# EAGLE design rotor_khamex_3.9_completo (EAGLE 7.6.0)

## Sheet 1 of 2
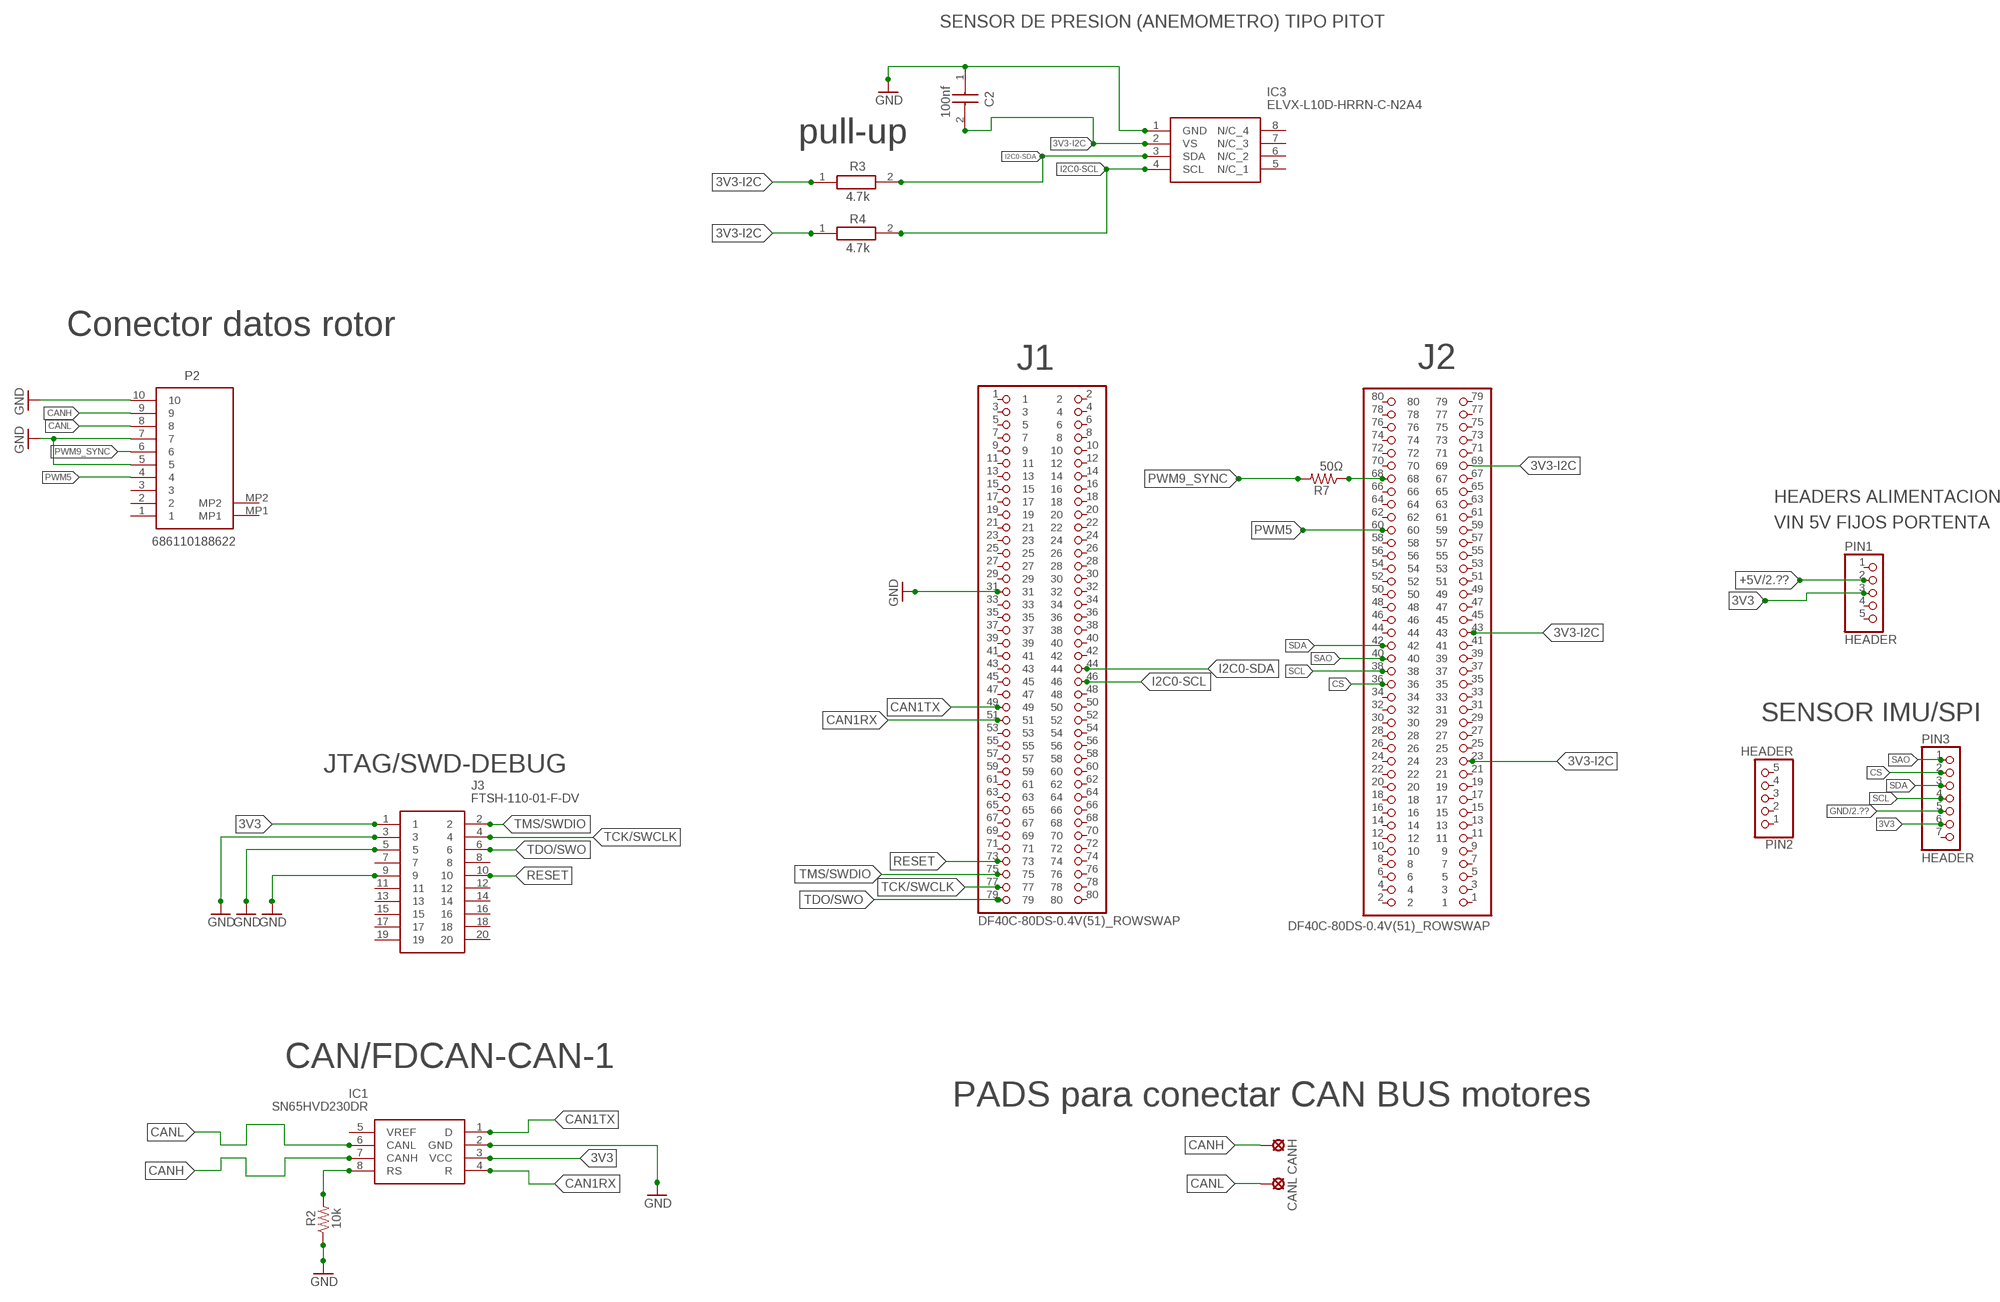
[diagram p0: schematic, sheet 1]

### Parts
C2  100nf  VJ0805Y104KCAAJ  [CAPC2012X145N]
CANH  LSP11  [LSP11]
CANL  LSP11  [LSP11]
IC1  SN65HVD230DR  [SOT127P600X175-8N]
IC3  ELVX-L10D-HRRN-C-N2A4  [ELVXL10DHRRNCN2A4]
J1  DF40C-80DS-0.4V(51)_ROWSWAP  [HRS_DF40C-80DS-0.4V(51)_ROWSWAP]
J2  DF40C-80DS-0.4V(51)_ROWSWAP  [HRS_DF40C-80DS-0.4V(51)_ROWSWAP]
J3  FTSH-110-01-F-DV  [FTSH-110-XX-YYY-DV]
P2  686110188622  [686110188622]
PIN1  HEADER  PINHD-1X5  [1X05]
PIN2  HEADER  PINHD-1X5  [1X05]
PIN3  HEADER  PINHD-1X7  [1X07]
R2  10k  R-US_M0805  [M0805]
R3  4.7k  CRCW08054K70FKEA  [RESC2012X50N]
R4  4.7k  CRCW08054K70FKEA  [RESC2012X50N]
R7  50Ω  R-US_M0805  [M0805]

### Nets
3V3: IC1.3(VCC) J3.1 PIN1.3 PIN3.6
3V3-I2C: C2.2 IC3.2(VS) J2.23 J2.43 J2.69 R3.1 R4.1
+5V [power]: PIN1.2 ; also sheet 2
CAN1RX: IC1.4(R) J1.51
CAN1TX: IC1.1(D) J1.49
CANH: CANH.MP IC1.7(CANH) P2.9
CANL: CANL.MP IC1.6(CANL) P2.8
CS: J2.36 PIN3.2
GND [power]: C2.1 IC1.2(GND) IC3.1(GND) J1.31 J3.3 J3.5 J3.9 P2.5 P2.7 P2.10 PIN3.5 R2.1 ; also sheet 2
I2C0-SCL: IC3.4(SCL) J1.46 R4.2
I2C0-SDA: IC3.3(SDA) J1.44 R3.2
N$15: IC1.8(RS) R2.2
PWM5: J2.60 P2.4
PWM9_SYNC: J2.68 P2.6 R7.1 R7.2
RESET: J1.73 J3.10
SAO: J2.40 PIN3.1
SCL: J2.38 PIN3.4
SDA: J2.42 PIN3.3
TCK/SWCLK: J1.77 J3.4
TDO/SWO: J1.79 J3.6
TMS/SWDIO: J1.75 J3.2
Unconnected: IC1.5(VREF) IC3.5(N/C_1) IC3.6(N/C_2) IC3.7(N/C_3) IC3.8(N/C_4) J1.1 J1.2 J1.3 J1.4 J1.5 J1.6 J1.7 J1.8 J1.9 J1.10 J1.11 J1.12 J1.13 J1.14 J1.15 J1.16 J1.17 J1.18 J1.19 J1.20 J1.21 J1.22 J1.23 J1.24 J1.25 J1.26 J1.27 J1.28 J1.29 J1.30 J1.32 J1.33 J1.34 J1.35 J1.36 J1.37 J1.38 J1.39 J1.40 J1.41 J1.42 J1.43 J1.45 J1.47 J1.48 J1.50 J1.52 J1.53 J1.54 J1.55 J1.56 J1.57 J1.58 J1.59 J1.60 J1.61 J1.62 J1.63 J1.64 J1.65 J1.66 J1.67 J1.68 J1.69 J1.70 J1.71 J1.72 J1.74 J1.76 J1.78 J1.80 J2.1 J2.2 J2.3 J2.4 J2.5 J2.6 J2.7 J2.8 J2.9 J2.10 J2.11 J2.12 J2.13 J2.14 J2.15 J2.16 J2.17 J2.18 J2.19 J2.20 J2.21 J2.22 J2.24 J2.25 J2.26 J2.27 J2.28 J2.29 J2.30 J2.31 J2.32 J2.33 J2.34 J2.35 J2.37 J2.39 J2.41 J2.44 J2.45 J2.46 J2.47 J2.48 J2.49 J2.50 J2.51 J2.52 J2.53 J2.54 J2.55 J2.56 J2.57 J2.58 J2.59 J2.61 J2.62 J2.63 J2.64 J2.65 J2.66 J2.67 J2.70 J2.71 J2.72 J2.73 J2.74 J2.75 J2.76 J2.77 J2.78 J2.79 J2.80 J3.7 J3.8 J3.11 J3.12 J3.13 J3.14 J3.15 J3.16 J3.17 J3.18 J3.19 J3.20 P2.1 P2.2 P2.3 P2.MP1 P2.MP2 PIN1.1 PIN1.4 PIN1.5 PIN2.1 PIN2.2 PIN2.3 PIN2.4 PIN2.5 PIN3.7

### Notes on the sheet
- SENSOR DE PRESION (ANEMOMETRO) TIPO PITOT
- pull-up
- 4.7k
- 4.7k
- Conector datos rotor
- HEADERS ALIMENTACION
- VIN 5V FIJOS PORTENTA
- SENSOR IMU/SPI
- JTAG/SWD-DEBUG
- CAN/FDCAN-CAN-1
- PADS para conectar CAN BUS motores

## Sheet 2 of 2
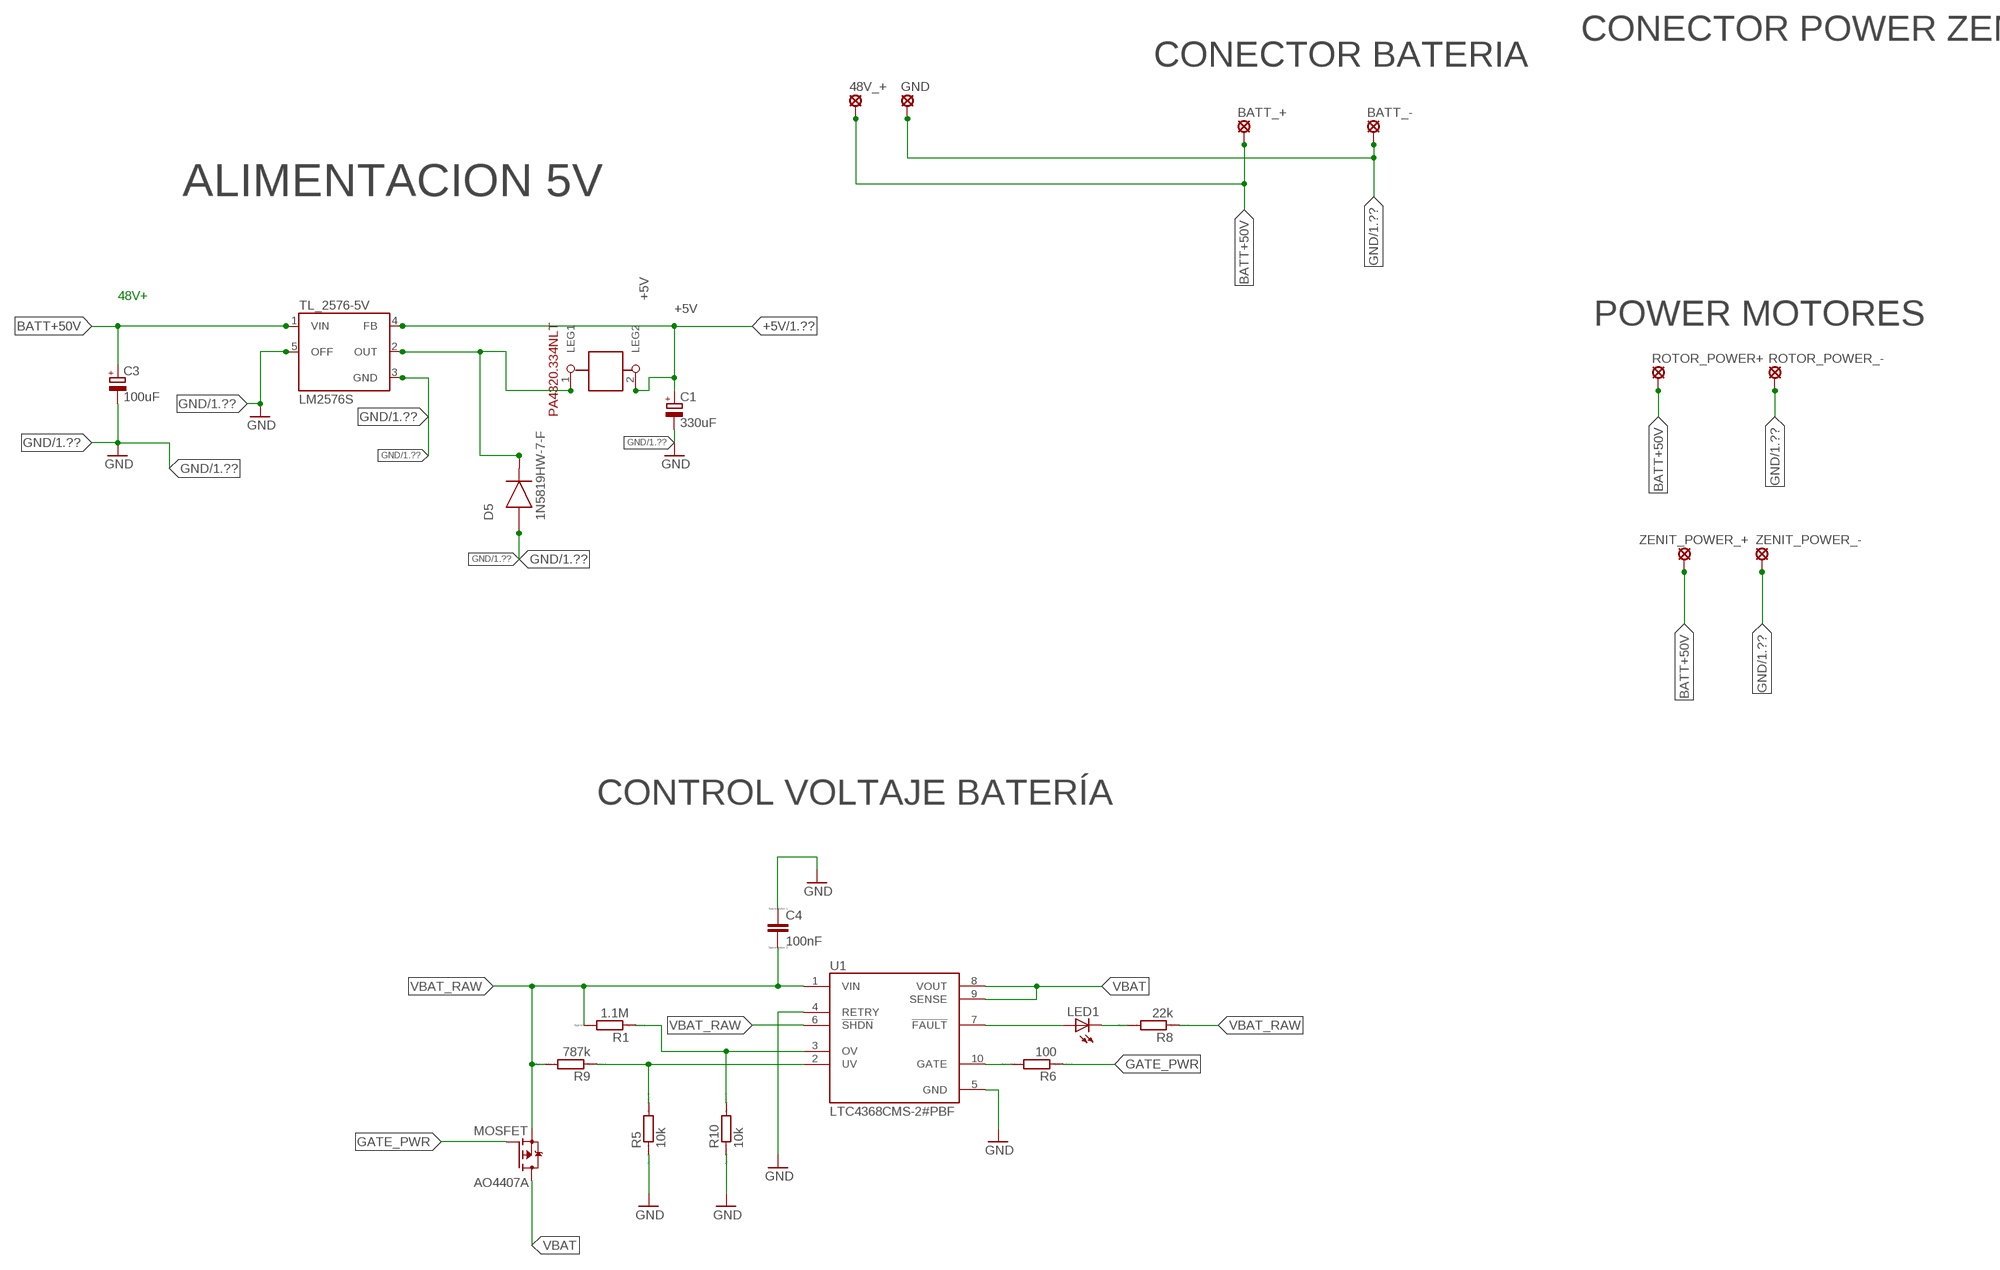
[diagram p1: schematic, sheet 2]

### Parts
48V_+  SE14  [SE14]
BATT_+  SE14  [SE14]
BATT_-  SE14  [SE14]
C1  330uF  CPOL-EUE5-10.5  [E5-10,5]
C3  100uF  CPOL-EUE5-10.5  [E5-10,5]
C4  100nF  C  [C0805]
D5  1N5819HW-7-F  [SOD370155X135]
GND  SE14  [SE14]
L  1212  [1212SMDINDUCTORPACK]
LED1  LED  [SMARTLED-TTW]
MOSFET  AO4407A  [SOIC127P600X175-8N]
R1  1.1M  R  [R0805]
R5  10k  R  [R0805]
R6  100  R  [R0805]
R8  22k  R  [R0805]
R9  787k  R  [R0805]
R10  10k  R  [R0805]
ROTOR_POWER+  SE14  [SE14]
ROTOR_POWER_-  SE14  [SE14]
TL_2576-5V  LM2576S  [TO263-5]
U1  LTC4368CMS-2#PBF  [SOP50P490X110-10N]
ZENIT_POWER_+  SE14  [SE14]
ZENIT_POWER_-  SE14  [SE14]

### Nets
+5V [power]: C1.+ L.2(LEG2) TL_2576-5V.4(FB) ; also sheet 1
BATT+50V [power]: 48V_+.MP BATT_+.MP C3.+ D5.1(C) L.1(LEG1) ROTOR_POWER+.MP TL_2576-5V.1(VIN) TL_2576-5V.2(OUT) ZENIT_POWER_+.MP
GATE_PWR: MOSFET.4(G) R6.1
GND [power]: BATT_-.MP C1.- C3.- C4.1 D5.2(A) GND.MP R5.1 R10.1 ROTOR_POWER_-.MP TL_2576-5V.3(GND) TL_2576-5V.5(OFF) U1.4(RETRY) U1.5(GND) ZENIT_POWER_-.MP ; also sheet 1
N$2: LED1.A@1(A) U1.7(!FAULT)
N$11: R5.2 R9.1 U1.2(UV)
N$12: R1.1 R10.2 U1.3(OV)
N$13: LED1.C@1(C) R8.2
N$14: R6.2 U1.10(GATE)
VBAT: MOSFET.5(D) MOSFET.6(D) MOSFET.7(D) MOSFET.8(D) U1.8(VOUT) U1.9(SENSE)
VBAT_RAW: C4.2 MOSFET.1(S) MOSFET.2(S) MOSFET.3(S) R1.2 R8.1 R9.2 U1.1(VIN) U1.6(!SHDN)

### Notes on the sheet
- CONECTOR POWER ZENIT
- CONECTOR BATERIA
- ALIMENTACION 5V
- 48V+
- POWER MOTORES
- CONTROL VOLTAJE BATERÍA

## Library data of the parts
48V_+ BATT_+ BATT_- GND ROTOR_POWER+ ROTOR_POWER_- ZENIT_POWER_+ ZENIT_POWER_- = solpad:SE14: SOLDER PAD E1553, drill 1,4mm, distributor Buerklin, 07F820
C1 C3 = rcl:CPOL-EU: POLARIZED CAPACITOR, European symbol
C2 = VJ0805Y104KCAAJ:VJ0805Y104KCAAJ: Vishay VJ0805 series Capacitor Chips Source: Datasheet <http://www.vishay.com/docs/45226/vj31xrohsautomlcc.pdf>; DESCRIPTION: Vishay VJ0805 series Capacitor Chips; HEIGHT: 1.45mm; MANUFACTURER_NAME: Vishay; MANUFACTURER_PART_NUMBER: VJ0805Y104KCAAJ
C4 = eagle-ltspice:C: CAPACITOR, European symbol; SPICEMODEL: NONE; SPICEPREFIX: C
CANH CANL = solpad:LSP11: SOLDER PAD drill 1.1 mm
D5 = 1N5819HW-7-F:1N5819HW-7-F: 1N5819HW Series 40 V 1 A Surface Mount Schottky Barrier Rectifier - SOD-123; DESCRIPTION: 1N5819HW Series 40 V 1 A Surface Mount Schottky Barrier Rectifier - SOD-123; DIGI-KEY_PART_NUMBER: 1N5819HW-FDICT-ND; DIGI-KEY_PURCHASE_URL: https://www.digikey.es/product-detail/en/diodes-incorporated/1N5819HW-7-F/1N5819HW-FDICT-ND/815283?utm_source=snapeda&utm_medium=aggregator&utm_campaign=symbol; MF: Diodes Inc.; MP: 1N5819HW-7-F; PACKAGE: SOD-123 Diodes Inc.
IC1 = SN65HVD230DR:SN65HVD230DR: 3.3 V CAN Transceiver with Standby Mode Source: Datasheet <http://www.ti.com/lit/gpn/sn65hvd230>; DESCRIPTION: 3.3 V CAN Transceiver with Standby Mode; HEIGHT: 1.75mm; MANUFACTURER_NAME: Texas Instruments; MANUFACTURER_PART_NUMBER: SN65HVD230DR; MOUSER_PART_NUMBER: 595-SN65HVD230DR; MOUSER_PRICE-STOCK: https://www.mouser.co.uk/ProductDetail/Texas-Instruments/SN65HVD230DR?qs=QViXGNcIEAtifeQR3pYVUQ%3D%3D
IC3 = ELVX-L10D-HRRN-C-N2A4:ELVX-L10D-HRRN-C-N2A4: Pressure Sensor +/-0.36PSI (+/-2.49kPa) Differential Male - 0.08" (1.93mm) Tube, Dual 14 b 8-SMD, No Lead, Dual Ports, Same Side, 3.3V, -25C ~ 85C Source: Datasheet <https://allsensors.com/hubfs/Product-Data-Sheets/DS-0452.pdf>; DESCRIPTION: Pressure Sensor +/-0.36PSI (+/-2.49kPa) Differential Male - 0.08" (1.93mm) Tube, Dual 14 b 8-SMD, No Lead, Dual Ports, Same Side, 3.3V, -25C ~ 85C; HEIGHT: 4.33mm; MANUFACTURER_NAME: Amphenol; MANUFACTURER_PART_NUMBER: ELVX-L10D-HRRN-C-N2A4
J1 J2 = DF40C-80DS-0.4V_51_ROWSWAP:DF40C-80DS-0.4V(51)_ROWSWAP; CHECK_PRICES: https://www.snapeda.com/parts/DF40C-80DS-0.4V(51)/Hirose/view-part/?ref=eda; DESCRIPTION: Receptáculo del conector de la posición 80, contactos de la tira central Montaje en superficie Oro; DIGIKEY_PART_NUMBER: H11633CT-ND; MF: Hirose; MP: DF40C-80DS-0.4V(51); PACKAGE: None; SNAPEDA_LINK: https://www.snapeda.com/parts/DF40C-80DS-0.4V(51)/Hirose/view-part/?ref=snap
J3 = FTSH-110-01-F-DV:FTSH-110-01-F-DV: 20 Position, High Reliability Header Strips, 0.050" pitch Source: Datasheet <http://suddendocs.samtec.com/prints/ftsh-1xx-xx-xxx-dv-xxx-xxx-mkt.pdf>; DESCRIPTION: 20 Position, High Reliability Header Strips, 0.050&quot; pitch; HEIGHT: mm; MANUFACTURER_NAME: SAMTEC; MANUFACTURER_PART_NUMBER: FTSH-110-01-F-DV; MOUSER_PART_NUMBER: 200-FTSH11001FDV; MOUSER_PRICE-STOCK: https://www.mouser.co.uk/ProductDetail/Samtec/FTSH-110-01-F-DV?qs=92ilVni64gw1JaTDl9rCLg%3D%3D
L = smd 1212 inductor:1212
LED1 = led:LED: LED OSRAM: - CHIPLED LG R971, LG N971, LY N971, LG Q971, LY Q971, LO R971, LY R971 LH N974, LH R974 LS Q976, LO Q976, LY Q976 LO Q996 - Hyper CHIPLED LW Q18S LB Q993, LB Q99A, LB R99A - SideLED LS A670, LO A670, LY A670, LG A670, LP A670 LB A673, LV A673, LT A673, LW A673 LH A674 LY A675 LS A676, LA A676, LO A676, LY A676, LW A676 LS A679, LY A679, LG A679 - Hyper Micro SIDELED® LS Y876, LA Y876, LO Y876, LY Y876 LT Y87S - SmartLED LW L88C, LW L88S LB L89C, LB L89S, LG L890 LS L89K, LO L89K, LY L89K LS L896, LA L896, LO L896, LY L896 - TOPLED LS T670, LO T670, LY T670, LG T670, LP T670 LSG T670, LSP T670, LSY T670, LOP T670, LYG T670 LG T671, LOG T671, LSG T671 LB T673, LV T673, LT T673, LW T673 LH T674 LS T676, LA T676, LO T676, LY T676, LB T676, LH T676, LSB T676, LW T676 LB T67C, LV T67C, LT T67C, LS T67K, LO T67K, LY T67K, LW E67C LS E67B, LA E67B, LO E67B, LY E67B, LB E67C, LV E67C, LT E67C LW T67C LS T679, LY T679, LG T679 LS T770, LO T770, LY T770, LG T770, LP T770 LB T773, LV T773, LT T773, LW T773 LH T774 LS E675, LA E675, LY E675, LS T675 LS T776, LA T776, LO T776, LY T776, LB T776 LHGB T686 LT T68C, LB T68C - Hyper Mini TOPLED® LB M676 - Mini TOPLED Santana® LG M470 LS M47K, LO M47K, LY M47K Source: http://www.osram.convergy.de LUXEON: - LUMILED® LXK2-PW12-R00, LXK2-PW12-S00, LXK2-PW14-U00, LXK2-PW14-V00 LXK2-PM12-R00, LXK2-PM12-S00, LXK2-PM14-U00 LXK2-PE12-Q00, LXK2-PE12-R00, LXK2-PE12-S00, LXK2-PE14-T00, LXK2-PE14-U00 LXK2-PB12-K00, LXK2-PB12-L00, LXK2-PB12-M00, LXK2-PB14-N00, LXK2-PB14-P00, LXK2-PB14-Q00 LXK2-PR12-L00, LXK2-PR12-M00, LXK2-PR14-Q00, LXK2-PR14-R00 LXK2-PD12-Q00, LXK2-PD12-R00, LXK2-PD12-S00 LXK2-PH12-R00, LXK2-PH12-S00 LXK2-PL12-P00, LXK2-PL12-Q00, LXK2-PL12-R00 Source: www.luxeon.com KINGBRIGHT: KA-3528ASYC Source: www.kingbright.com
MOSFET = AO4407A:AO4407A: Check availability <https://pricing.snapeda.com/parts/AO4407A/Alpha%20%26/view-part?ref=eda>; AVAILABILITY: In Stock; CHECK_PRICES: https://www.snapeda.com/parts/AO4407A/Alpha/view-part/?ref=eda; DESCRIPTION: P-Channel 30 V 12A (Ta) 3.1W (Ta) Surface Mount 8-SOIC; MF: Alpha &; MP: AO4407A; PACKAGE: SOIC-8 Alpha &amp; Omega Semiconductor; PRICE: None; SNAPEDA_LINK: https://www.snapeda.com/parts/AO4407A/Alpha/view-part/?ref=snap
P2 = 686110188622:686110188622: FFC & FPC Connectors WR-FPC 1,0mm SMT Horiz. Top Contact Tin Plating{0000} Source: Datasheet <https://www.mouser.ch/datasheet/2/445/686110188622-1843591.pdf>; DESCRIPTION: FFC & FPC Connectors WR-FPC 1,0mm SMT Horiz. Top Contact Tin Plating{0000}; HEIGHT: 3.3mm; MANUFACTURER_NAME: Wurth Elektronik; MANUFACTURER_PART_NUMBER: 686110188622; MOUSER_PART_NUMBER: 710-686110188622; MOUSER_PRICE-STOCK: https://www.mouser.co.uk/ProductDetail/Wurth-Elektronik/686110188622?qs=OlC7AqGiEDnHUpT6yh27Lg%3D%3D
PIN1 PIN2 = pinhead:PINHD-1X5: PIN HEADER
PIN3 = pinhead:PINHD-1X7: PIN HEADER
R1 R5 R6 R8-R10 = eagle-ltspice:R: RESISTOR, European symbol; SPICEMODEL: NONE; SPICEPREFIX: R
R2 R7 = rcl:R-US_: RESISTOR, American symbol
R3 R4 = CRCW08054K70FKEA:CRCW08054K70FKEA: Vishay CRCW Series Thick Film Surface Mount Resistor 805 Case 4.7k +/-1% 0.125W +/-100ppm/C Source: Datasheet <http://www.vishay.com/docs/20035/dcrcwe3.pdf>; DESCRIPTION: Vishay CRCW Series Thick Film Surface Mount Resistor 805 Case 4.7k +/-1% 0.125W +/-100ppm/C; HEIGHT: 0.5mm; MANUFACTURER_NAME: Vishay; MANUFACTURER_PART_NUMBER: CRCW08054K70FKEA; MOUSER_PART_NUMBER: 71-CRCW0805-4.7K-E3; MOUSER_PRICE-STOCK: https://www.mouser.co.uk/ProductDetail/Vishay-Dale/CRCW08054K70FKEA?qs=kkyyugUlSrMIzNiWjd4LGQ%3D%3D
TL_2576-5V = v-reg-3:LM2576: National Semiconductor <http://www.national.com> 3.0A "Simple Switcher"(c) 52kHz, Vout 1.23-37V (HV: 57V), Vin 40V (HV: 60V), 50µA standby current
U1 = LTC4368CMS-2_PBF:LTC4368CMS-2#PBF: Check availability <https://pricing.snapeda.com/parts/LTC4368CMS-2%23PBF/Analog%20Devices/view-part?ref=eda>; AVAILABILITY: In Stock; CHECK_PRICES: https://www.snapeda.com/parts/LTC4368CMS-2%23PBF/Analog+Devices/view-part/?ref=eda; DESCRIPTION: 100V UV/OV and Reverse Protection Controller with Bidirectional Circuit Breaker; MF: Analog Devices; MP: LTC4368CMS-2#PBF; PACKAGE: MSOP-10 Analog Devices; PRICE: None; SNAPEDA_LINK: https://www.snapeda.com/parts/LTC4368CMS-2%23PBF/Analog+Devices/view-part/?ref=snap

## Net classes
0 default: width 0.152 mm, drill 0.305 mm, clearance 0.152 mm
1 power: width 0.127 mm, drill 0.305 mm, clearance 0.127 mm
2 thin: width 0.508 mm, drill 0.305 mm, clearance 0.152 mm

## Board
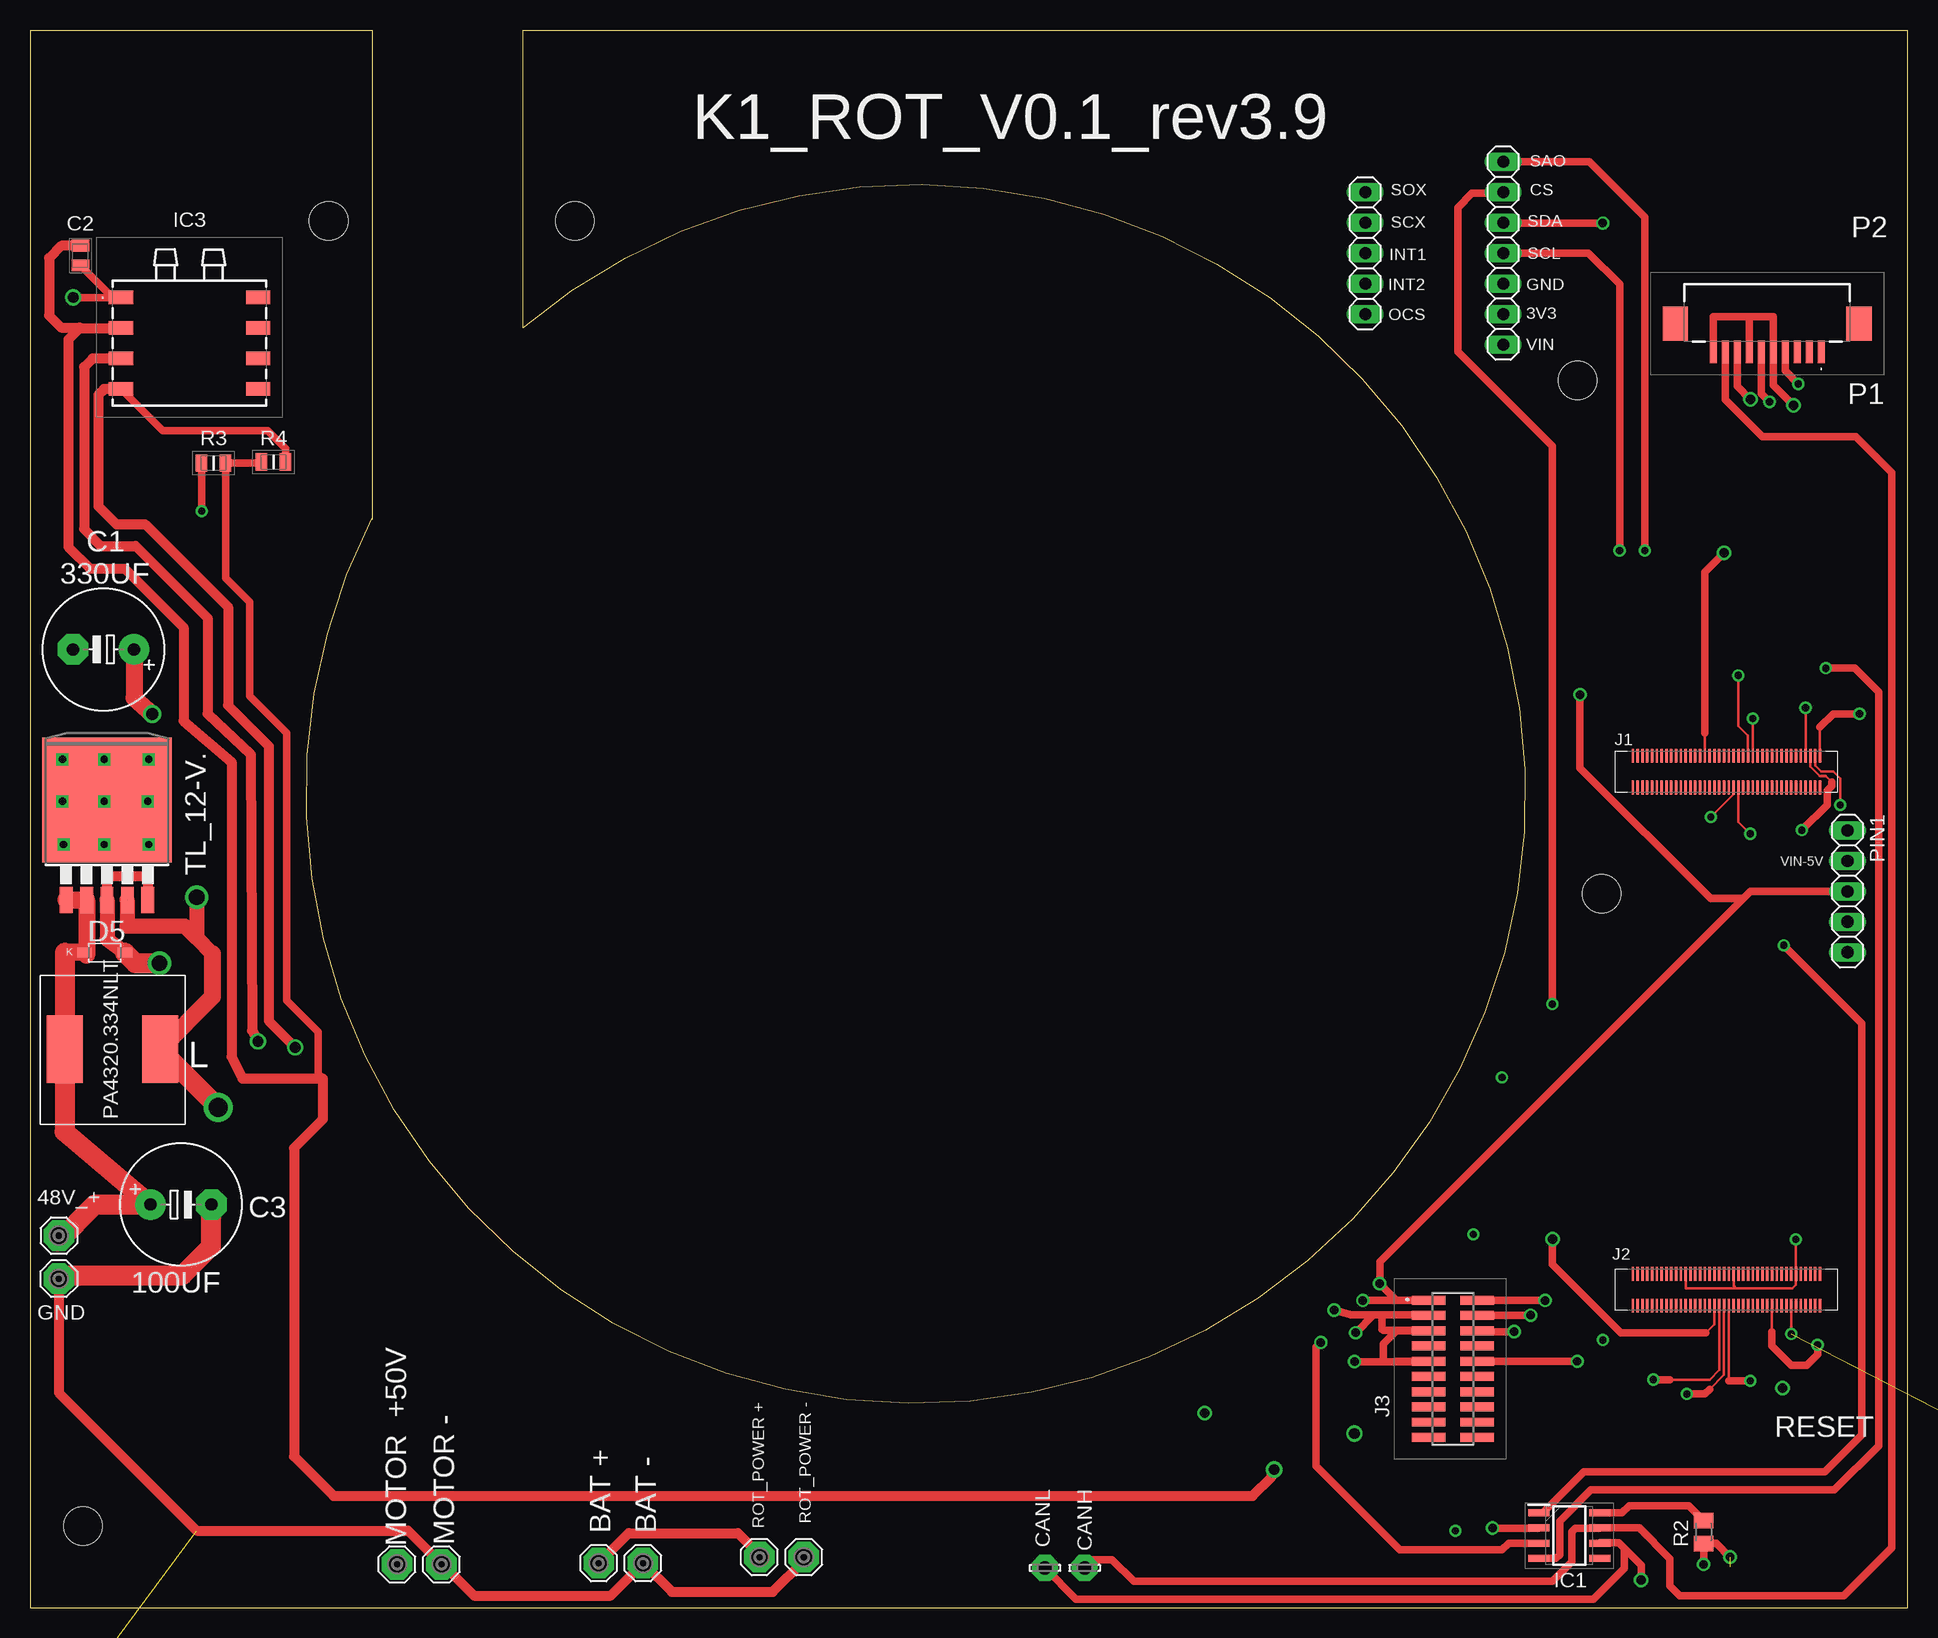
[diagram p2: board, top side]
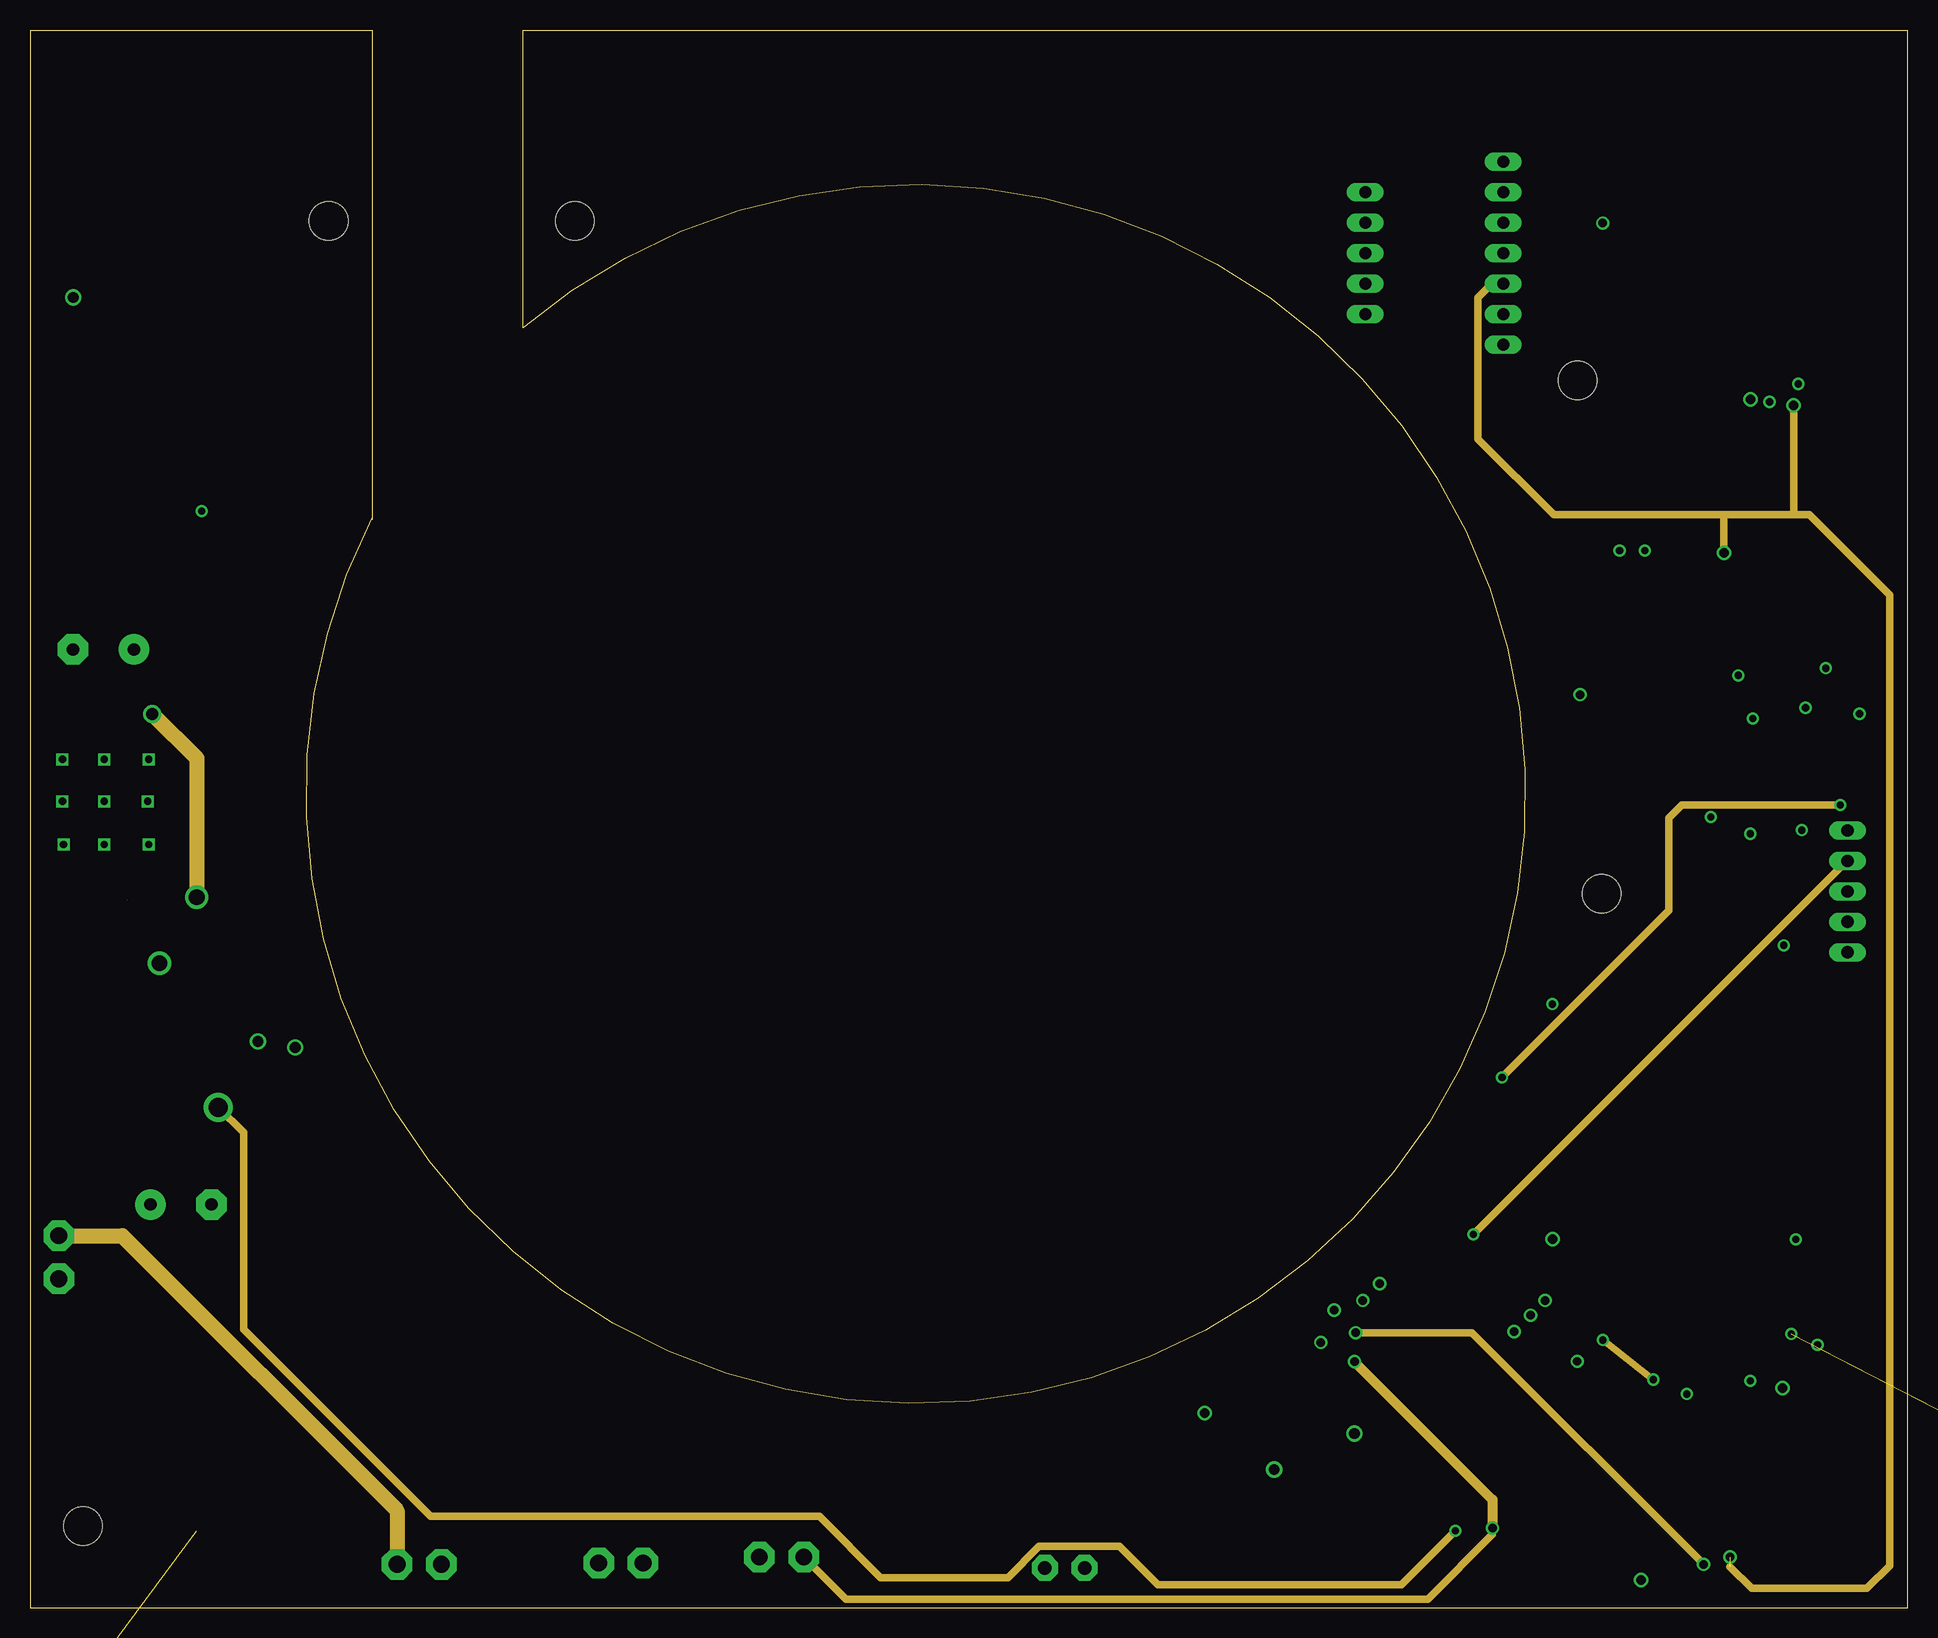
[diagram p3: board, inner layer Route2]
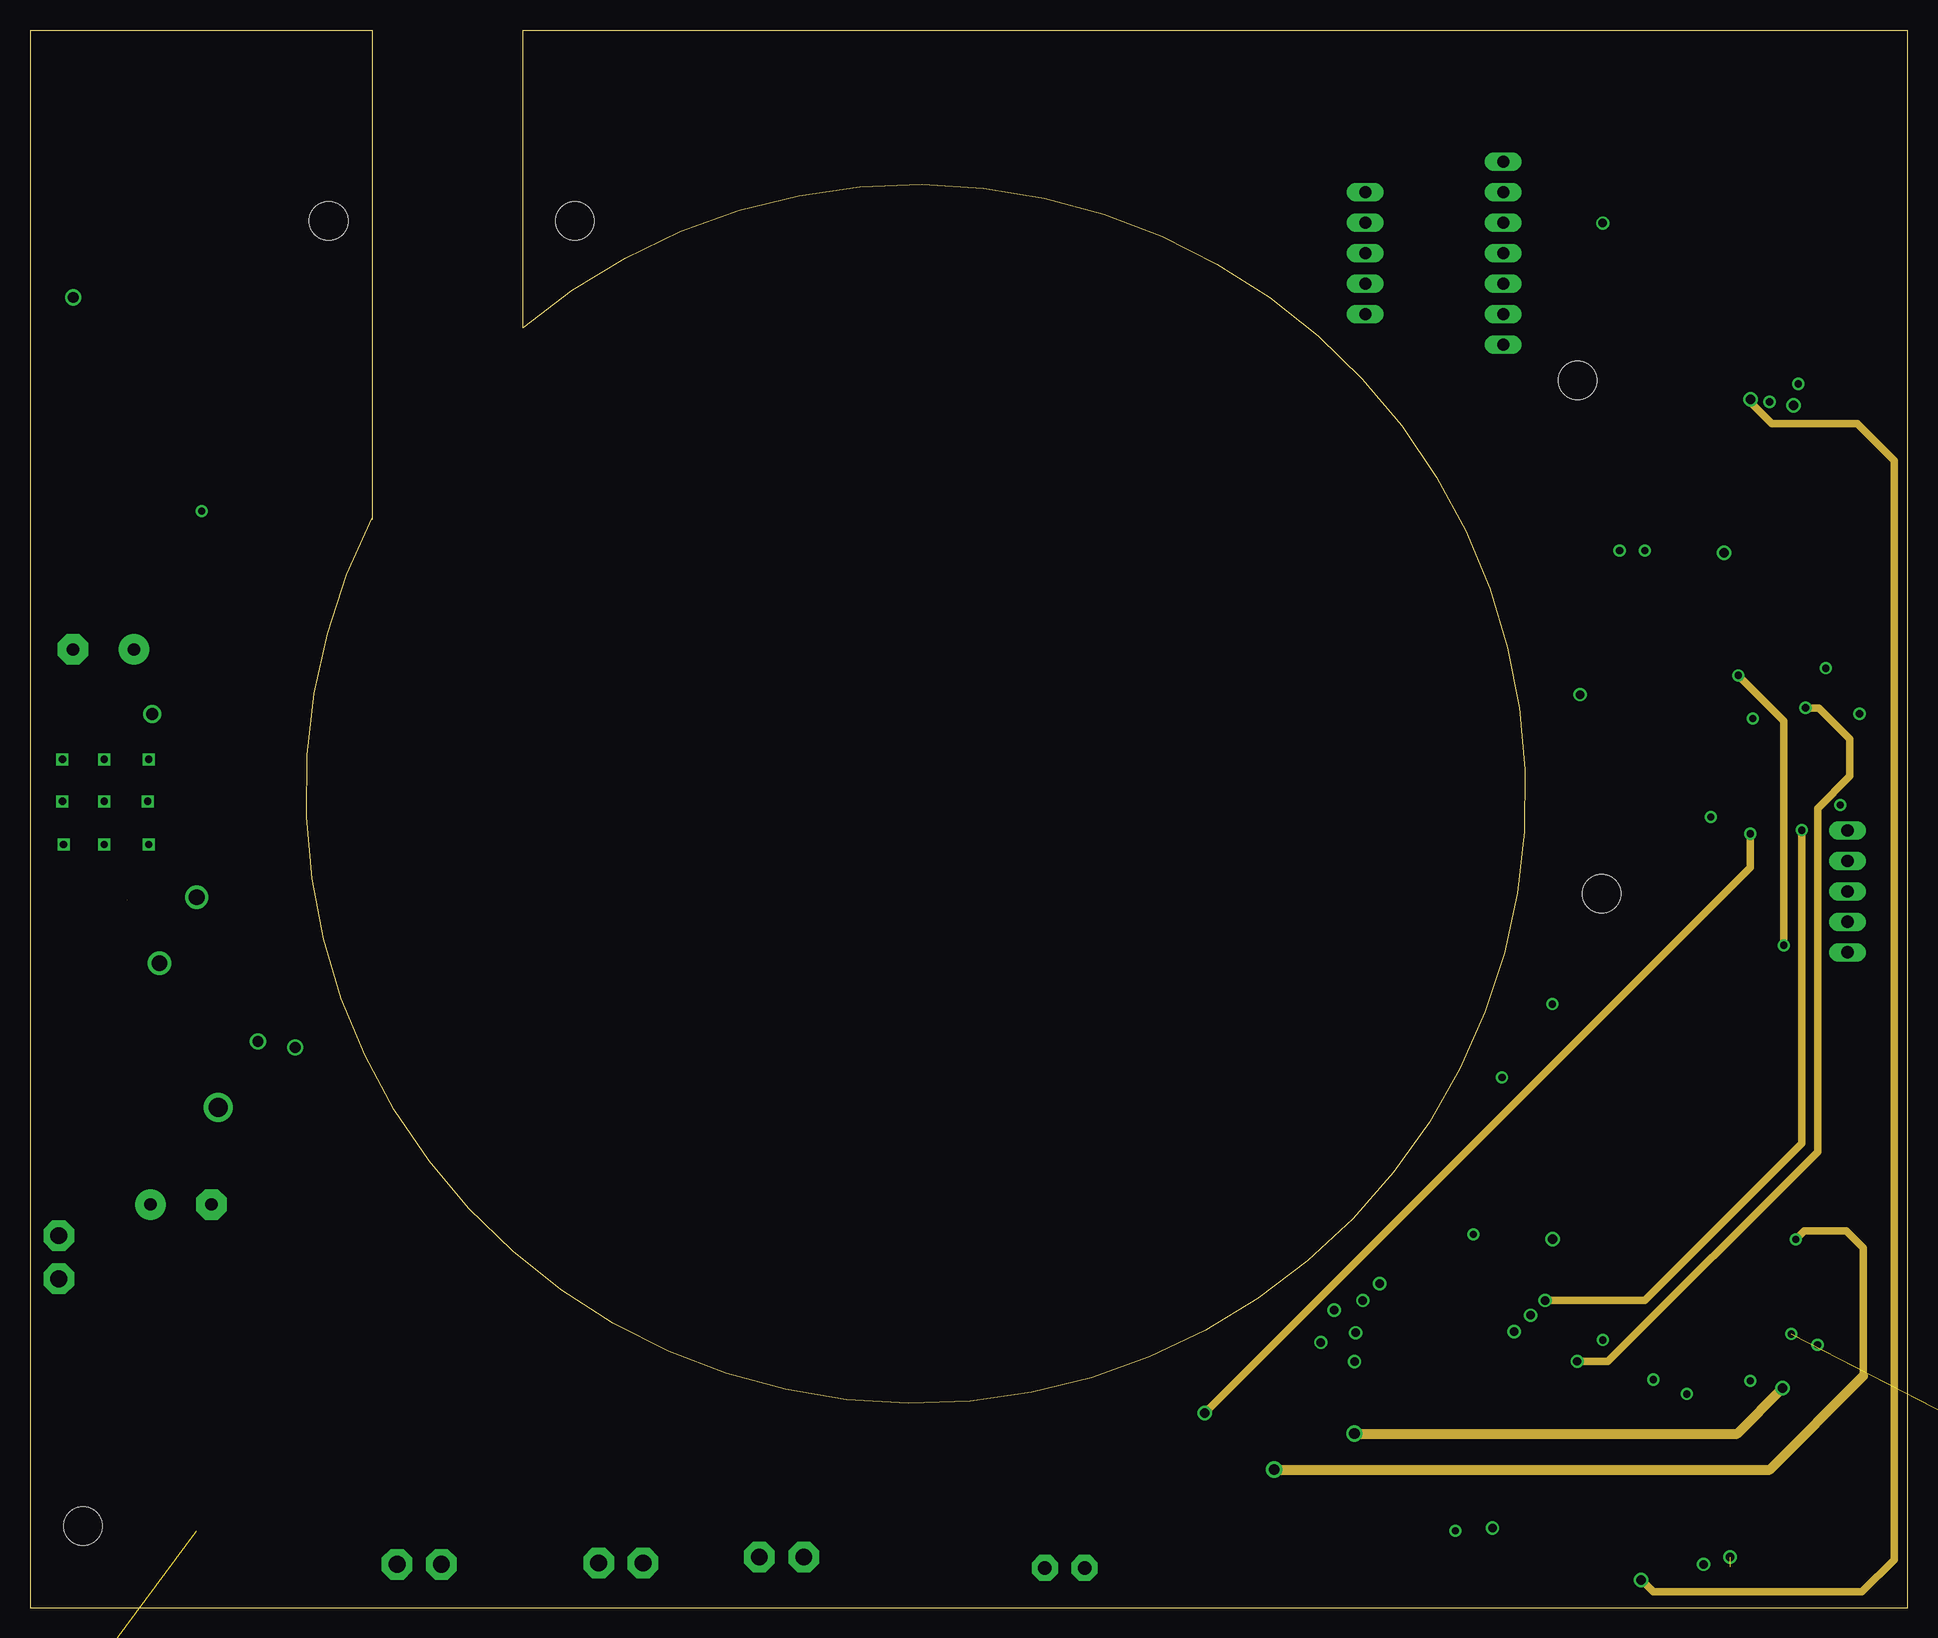
[diagram p4: board, inner layer Route15]
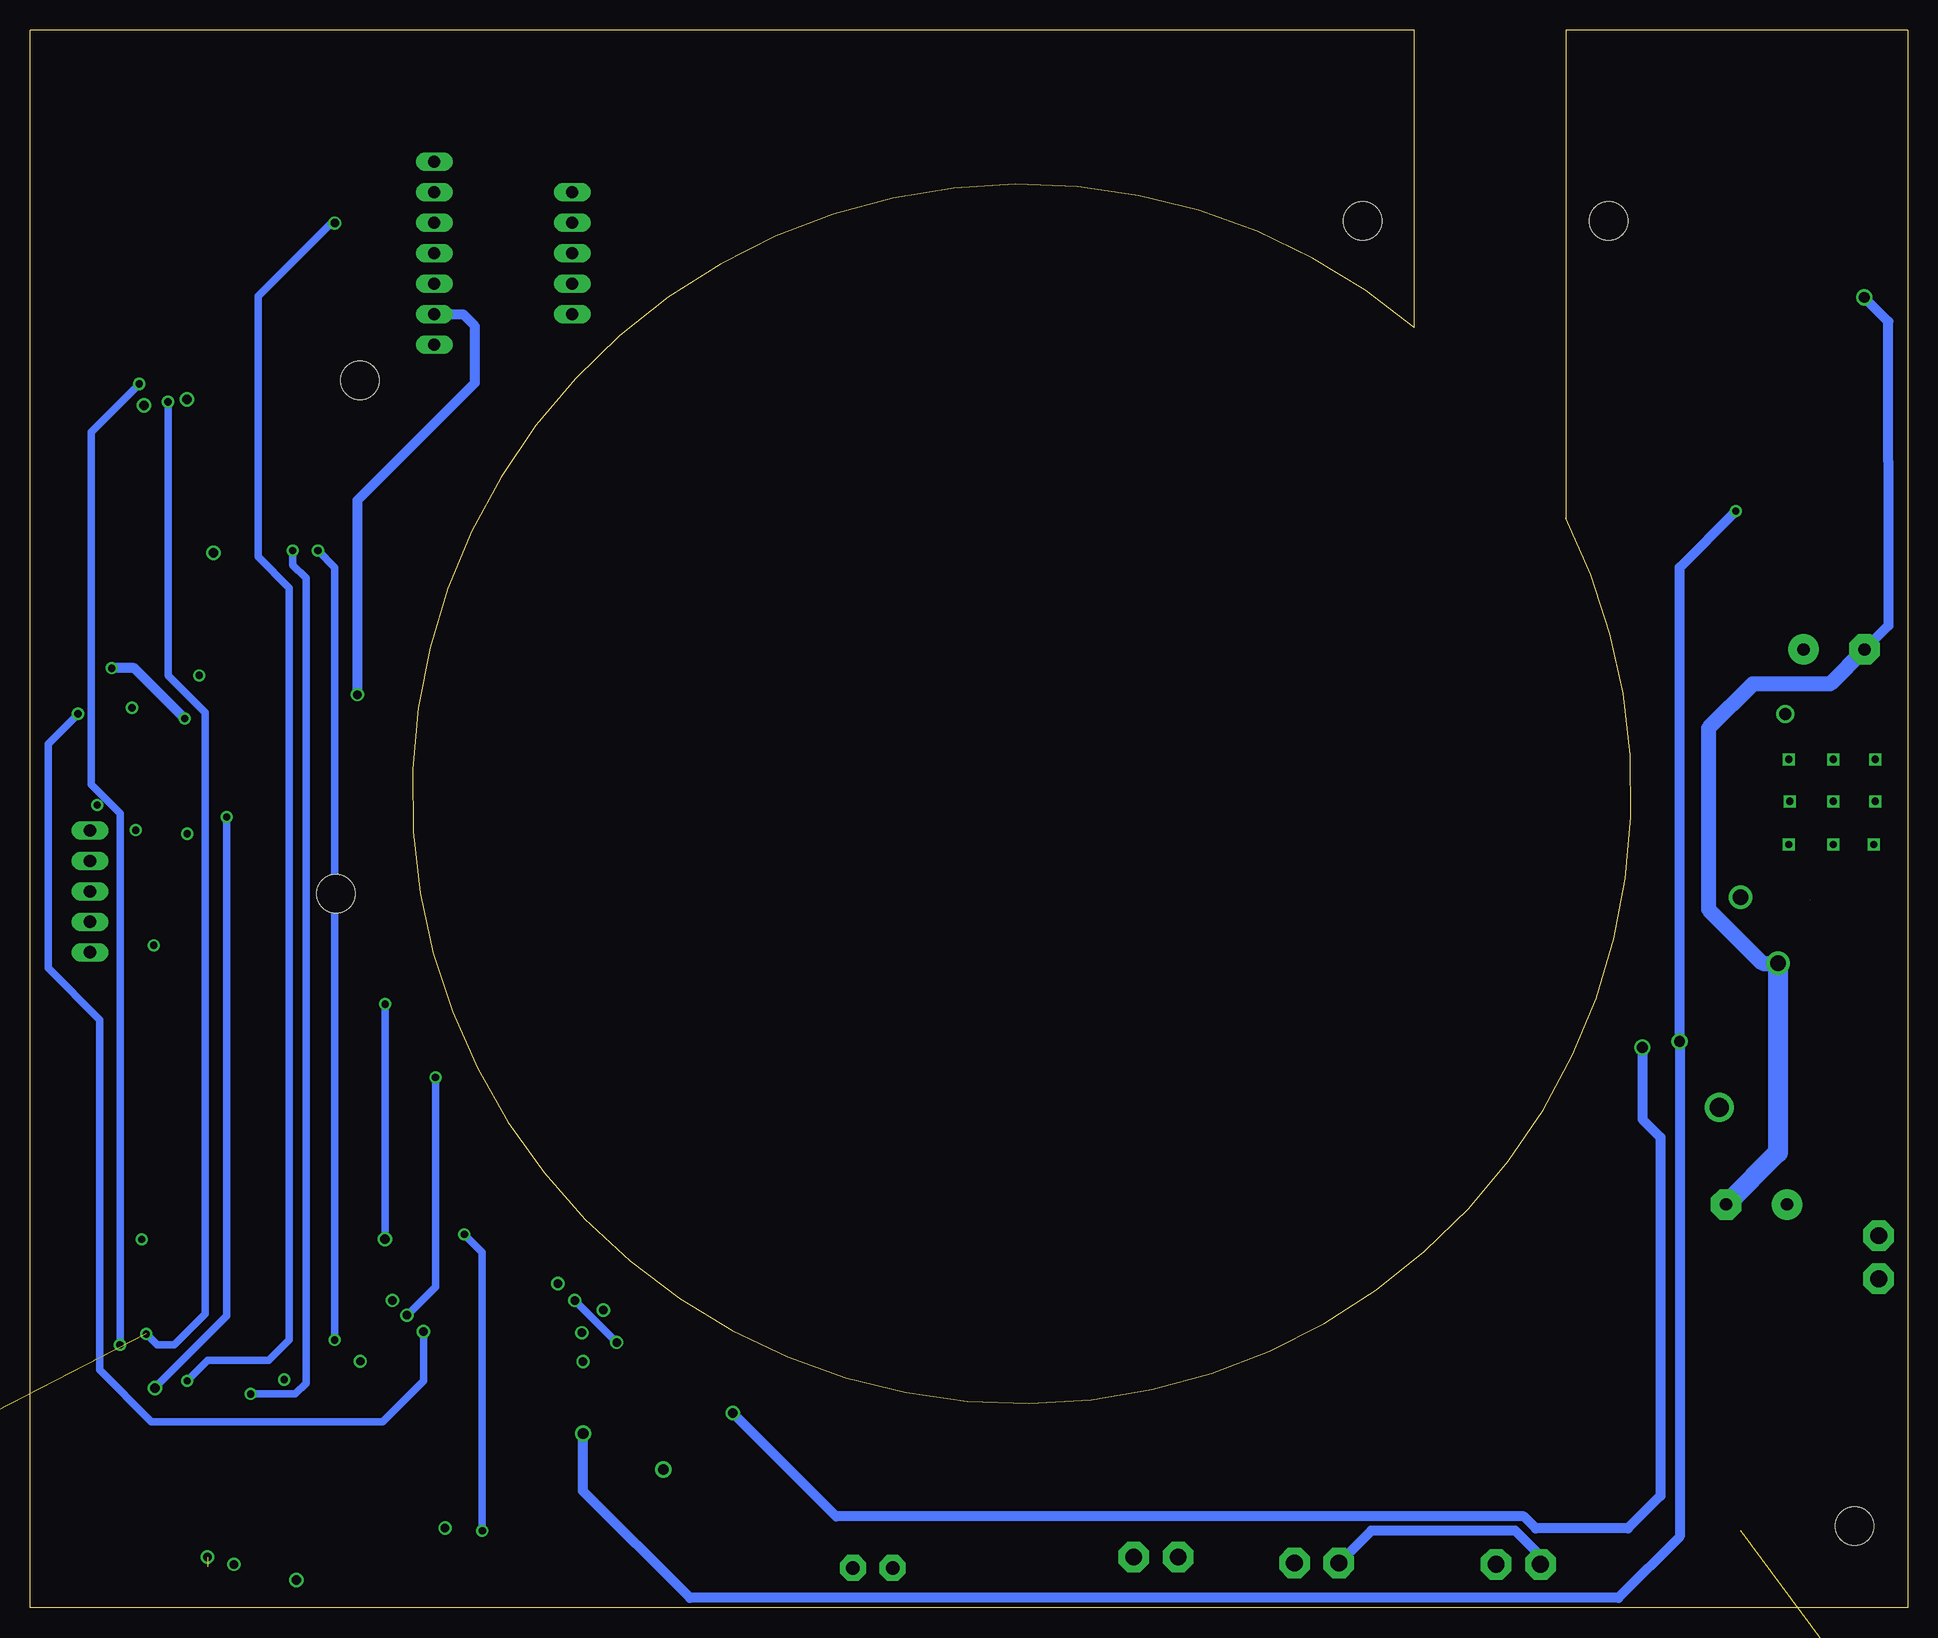
[diagram p5: board, bottom side, seen from below]

Size 156.5 x 131.5 mm. Coordinates in mm from the lower left corner, seen from the top.
Outline: 28.5,90.8 28.5,131.5 0,131.5 0,0 156.5,0 156.5,131.5 41.1,131.5 41.1,106.7 arc-337 28.5,90.8
Outline: 28.5,90.8 28.5,90.7
Copper layers (1*16): Top 0.035mm / dielectric 1.5mm / Bottom 0.035mm
Design rules "default": minimum track width 10mil, minimum drill 24mil, track to track 8mil, track to pad 8mil, pad to pad 8mil, via to via 8mil, smd to smd 8mil, copper to edge 40mil, drill to drill 8mil, minimum pad ring 10mil, minimum via ring 8mil, stop-mask expansion 4mil, vias tented up to drill 0mil, thermal gap 10mil
Holes 3.2 mm at 131,59.5 129,102.3 4.4,6.8 24.9,115.6 45.4,115.6

### Footprints (pad centres in the part's own frame; a part is rotated, then mirrored left to right if it is on the bottom)
SE14 = drill 1.397 pad 2.54 octagon: MP 0,0
E5-10,5 = drill 1.016 pad 2.54: + -2.54,0 | drill 1.016 pad 2.54 octagon: - 2.54,0
CAPC2012X145N = smd 0.99 x 1.47: 1 -0.82,0; 2 0.82,0
C0805 = smd 1.3 x 1.5: 1 -0.95,0; 2 0.95,0
LSP11 = drill 1.118 pad 2.159 octagon: MP 0,0
SOD370155X135 = smd 1.21 x 0.73: 1 -1.68,0; 2 1.68,0
SOT127P600X175-8N = smd 1.75 x 0.6: 1 -2.55,1.905; 2 -2.55,0.635; 3 -2.55,-0.635; 4 -2.55,-1.905; 5 2.55,-1.905; 6 2.55,-0.635; 7 2.55,0.635; 8 2.55,1.905
ELVXL10DHRRNCN2A4 = smd 2.03 x 1.14: 1 -5.715,2.5; 2 -5.715,-0.04; 3 -5.715,-2.58; 4 -5.715,-5.12; 5 5.715,-5.12; 6 5.715,-2.58; 7 5.715,-0.04; 8 5.715,2.5
HRS_DF40C-80DS-0.4V(51)_ROWSWAP = smd 0.2 x 1.14: 1 -7.8,1.32; 2 -7.8,-1.32; 3 -7.4,1.32; 4 -7.4,-1.32; 5 -7,1.32; 6 -7,-1.32; 7 -6.6,1.32; 8 -6.6,-1.32; 9 -6.2,1.32; 10 -6.2,-1.32; 11 -5.8,1.32; 12 -5.8,-1.32; 13 -5.4,1.32; 14 -5.4,-1.32; 15 -5,1.32; 16 -5,-1.32; 17 -4.6,1.32; 18 -4.6,-1.32; 19 -4.2,1.32; 20 -4.2,-1.32; 21 -3.8,1.32; 22 -3.8,-1.32; 23 -3.4,1.32; 24 -3.4,-1.32; 25 -3,1.32; 26 -3,-1.32; 27 -2.6,1.32; 28 -2.6,-1.32; 29 -2.2,1.32; 30 -2.2,-1.32; 31 -1.8,1.32; 32 -1.8,-1.32; 33 -1.4,1.32; 34 -1.4,-1.32; 35 -1,1.32; 36 -1,-1.32; 37 -0.6,1.32; 38 -0.6,-1.32; 39 -0.2,1.32; 40 -0.2,-1.32; 41 0.2,1.32; 42 0.2,-1.32; 43 0.6,1.32; 44 0.6,-1.32; 45 1,1.32; 46 1,-1.32; 47 1.4,1.32; 48 1.4,-1.32; 49 1.8,1.32; 50 1.8,-1.32; 51 2.2,1.32; 52 2.2,-1.32; 53 2.6,1.32; 54 2.6,-1.32; 55 3,1.32; 56 3,-1.32; 57 3.4,1.32; 58 3.4,-1.32; 59 3.8,1.32; 60 3.8,-1.32; 61 4.2,1.32; 62 4.2,-1.32; 63 4.6,1.32; 64 4.6,-1.32; 65 5,1.32; 66 5,-1.32; 67 5.4,1.32; 68 5.4,-1.32; 69 5.8,1.32; 70 5.8,-1.32; 71 6.2,1.32; 72 6.2,-1.32; 73 6.6,1.32; 74 6.6,-1.32; 75 7,1.32; 76 7,-1.32; 77 7.4,1.32; 78 7.4,-1.32; 79 7.8,1.32; 80 7.8,-1.32
FTSH-110-XX-YYY-DV = smd 0.74 x 2.79: 1 -5.715,-2.035; 2 -5.715,2.035; 3 -4.445,-2.035; 4 -4.445,2.035; 5 -3.175,-2.035; 6 -3.175,2.035; 7 -1.905,-2.035; 8 -1.905,2.035; 9 -0.635,-2.035; 10 -0.635,2.035; 11 0.635,-2.035; 12 0.635,2.035; 13 1.905,-2.035; 14 1.905,2.035; 15 3.175,-2.035; 16 3.175,2.035; 17 4.445,-2.035; 18 4.445,2.035; 19 5.715,-2.035; 20 5.715,2.035
1212SMDINDUCTORPACK = smd 5.6 x 3: 1 -0.1,3.91; 2 -0.1,-4.045
SMARTLED-TTW = smd 0.8 x 0.5: A 0,-0.875; C 0,0.875 | smd 0.35 x 0.35: A@1 0,-0.5; C@1 0,0.5
SOIC127P600X175-8N = smd 1.97 x 0.6: 1 -2.475,1.905; 2 -2.475,0.635; 3 -2.475,-0.635; 4 -2.475,-1.905; 5 2.475,-1.905; 6 2.475,-0.635; 7 2.475,0.635; 8 2.475,1.905
686110188622 = smd 0.6 x 1.9: 1 -4.5,2.825; 2 -3.5,2.825; 3 -2.5,2.825; 4 -1.5,2.825; 5 -0.5,2.825; 6 0.5,2.825; 7 1.5,2.825; 8 2.5,2.825; 9 3.5,2.825; 10 4.5,2.825 | smd 2.1 x 2.8: MP1 -7.65,0.475; MP2 7.65,0.475
1X05 = drill 1.016 long: 1 -5.08,0; 2 -2.54,0; 3 0,0; 4 2.54,0; 5 5.08,0
1X07 = drill 1.016 long: 1 -7.62,0; 2 -5.08,0; 3 -2.54,0; 4 0,0; 5 2.54,0; 6 5.08,0; 7 7.62,0
R0805 = smd 1.3 x 1.5: 1 -0.95,0; 2 0.95,0
M0805 = smd 1.3 x 1.6: 1 -0.95,0; 2 0.95,0
RESC2012X50N = smd 0.95 x 1.45: 1 -1,0; 2 1,0
TO263-5 = smd 1.067 x 2.159: 1 -3.404,-5.791; 2 -1.702,-5.791; 3 0,-5.791; 4 1.702,-5.791; 5 3.404,-5.791 | smd 10.8 x 10.41: 6 0,2.54
SOP50P490X110-10N = smd 1.45 x 0.28: 1 -2.16,1; 2 -2.16,0.5; 3 -2.16,0; 4 -2.16,-0.5; 5 -2.16,-1; 6 2.16,-1; 7 2.16,-0.5; 8 2.16,0; 9 2.16,0.5; 10 2.16,1

### Placement (x,y rotation side)
48V_+  2.4,31 0 top
BATT_+  47.4,3.7 180 top
BATT_-  51.1,3.7 180 top
C1  6.13,79.86 180 top
C2  4.2,112.7 90 top
C3  12.58,33.6 0 top
C4  -10.8,-42.6 0 top  (outside the outline)
CANH  87.9,3.3 0 top
CANL  84.6,3.3 0 top
D5  6.23,54.6 0 top
GND  2.4,27.4 270 top
IC1  128.3,6 0 top
IC3  13.3,106.7 0 top
J1  141.4,69.68 0 top
J2  141.4,26.49 0 top
J3  118.6,19.9 270 top
L  6.79,46.64 90 top
LED1  -10.5,-37.7 0 top  (outside the outline)
MOSFET  -3.8,-8.8 0 top  (outside the outline)
P2  144.8,107.5 180 top
PIN1  151.5,59.7 270 top
PIN2  111.3,112.9 90 top
PIN3  122.8,112.9 270 top
R1  -6,-16.5 0 top  (outside the outline)
R2  139.5,6.3 90 top
R3  15.3,95.4 180 top
R4  20.3,95.5 0 top
R5  -6,-20.5 0 top  (outside the outline)
R6  -6,-24.5 0 top  (outside the outline)
R7  173.3,8.2 90 top  (outside the outline)
R8  -6,-28.5 0 top  (outside the outline)
R9  -6,-32.5 0 top  (outside the outline)
R10  -6,-36.5 0 top  (outside the outline)
ROTOR_POWER+  60.8,4.2 180 top
ROTOR_POWER_-  64.5,4.2 180 top
TL_2576-5V  6.42,64.78 0 top
U1  3.7,-9.8 0 top  (outside the outline)
ZENIT_POWER_+  30.6,3.6 180 top
ZENIT_POWER_-  34.3,3.6 180 top

### Tracks (layer width: path | path; a pad name or v marks a point on that pad's centre or on a via)
3V3  (via drill 0.7)
  Top 0.61: v111.1,25.6 J3.1 113.89,25.61 v112.5,27 112.5,28.8 142.8,59.1 | IC1.3 123.27,5.37 122.7,4.8 114.2,4.8 107.2,11.8 107.2,21.7 v107.6,22.1 | PIN1.3 143.4,59.7 142.8,59.1 | v129.2,76.1 129.2,70 140.1,59.1 142.8,59.1
  Bottom 0.61: v107.6,22.1 v111.1,25.6
  Bottom 0.813: v129.2,76.1 129.2,92.3 119.4,102.1 119.4,106.8 120.4,107.8 122.78,107.8 PIN3.6
3V3-I2C  (via drill 0.6, 0.9)
  Top 0.2: 142.2,26.6 146.9,26.6 147.2,26.9 J2.69 v147.2,30.7 | 142.2,26.6 142,26.8 J2.43 | J2.23 138,26.6 142.2,26.6
  Top 0.61: R4.1 19.3,95.4 R3.1 16.3,85.8 18.3,83.8 18.3,76 21.4,72.9 21.4,50.6 24,48 24,44.5 24.4,44.1
  Top 0.813: 4.16,106.66 3.2,105.7 3.2,88.4 5,86.6 7.9,86.6 12.8,81.7 12.8,73.9 16.8,70.5 16.8,45.9 17.7,44.1 24.4,44.1 24.4,40.7 22,38.3 22,12.6 25.3,9.3 101.9,9.3 103.5,10.9 103.5,11.3 v103.7,11.5 | C2.2 2.62,113.52 1.6,112.5 1.6,107.7 2.6,106.7 4.12,106.7 4.16,106.66 | 4.16,106.66 IC3.2
  Route15 0.61: 152.8,19.3 152.8,30 151.4,31.4 147.9,31.4 v147.2,30.7
  Route15 0.813: v103.7,11.5 145,11.5 152.8,19.3
+5V  (via drill 0.6, 1, 1.3, 1.6)  (1 unrouted)
  Top 1.27: 8.1,58.99 8.1,56.8 12.9,56.8 13.9,55.8 | v13.9,59.2 13.9,55.8 | 13.9,55.8 15.2,54.5
  Top 1.422: 15.2,54.5 15.2,50.91 L.2 | C1.+ 8.67,75.83 v10.2,74.5
  Top 1.676: v15.7,41.7 15.68,41.7 L.2
  Route2 0.61: v15.7,41.7 17.8,39.6 17.8,23.2 33.4,7.6 65.8,7.6 70.9,2.5 81.5,2.5 84.1,5.1 90.8,5.1 94,1.9 114.3,1.9 v118.8,6.4 | PIN1.2 151.44,62.24 v120.3,31.1
  Route2 1.27: v10.2,74.5 13.9,70.8 v13.9,59.2
  Bottom 0.61: v118.8,6.4 118.8,29.6 v120.3,31.1
BATT+50V
  Top 0.813: 4.72,54.37 D5.1 | BATT_+.MP 49.9,6.2 59,6.2 60.8,4.4 ROTOR_POWER+.MP
  Top 1.422: TL_2576-5V.1 TL_2576-5V.2 4.72,54.37 | D5.1 2.9,54.6
  Top 1.676: 2.9,54.6 2.9,46.1 2.7,45.9 2.7,46.36 L.1 2.88,39.66 C3.+ 5.4,33.6 2.3,30.5 2.3,30.9 48V_+.MP
  Route2 1.27: 48V_+.MP 7.7,31 30.6,8.1 ZENIT_POWER_+.MP
  Bottom 0.813: ZENIT_POWER_+.MP 30.6,4.3 32.7,6.4 44.7,6.4 BATT_+.MP
CAN1RX  (via drill 0.6)
  Top 0.2: v143.6,74.1 J1.51 143.6,70.5
  Top 0.61: IC1.4 127.19,4.09 127.5,4.4 127.5,7.2 130.1,9.8 150.4,9.8 154.1,13.5 154.1,76.3 152.1,78.3 v149.7,78.3
  Bottom 0.813: v143.6,74.1 147.8,78.3 v149.7,78.3
CAN1TX  (via drill 0.6)
  Top 0.2: J1.49 143.2,72.7 142.4,73.5 v142.4,77.7
  Top 0.61: IC1.1 126.11,7.91 129.5,11.3 149.6,11.3 152.7,14.4 152.7,48.7 v146.2,55.2
  Route15 0.61: v146.2,55.2 146.2,73.9 v142.4,77.7
CANH
  Top 0.61: CANH.MP 88.6,4 90.2,4 92,2.2 126.9,2.2 128.5,3.8 128.5,6.3 128.8,6.6 130.81,6.6 IC1.7 130.87,6.65 134.13,6.65 136.7,4.08 136.7,1.8 137.5,1 151.2,1 155.2,5 155.2,94.6 152.2,97.6 144.4,97.6 141.3,100.7 P2.9
CANL  (via drill 0.8)
  Top 0.61: 132.88,4.95 132.45,5.38 130.87,5.38 IC1.6 | CANL.MP 87.2,0.7 130.3,0.7 132.88,3.28 132.88,4.95 | 132.88,4.95 134.3,3.53 v134.3,2.3 | v143.4,100.7 142.3,101.8 P2.8
  Route15 0.61: v134.3,2.3 135.3,1.3 152.7,1.3 155.4,4 155.4,95.6 152.3,98.7 145.2,98.7 143.4,100.5 v143.4,100.7
CS  (via drill 0.6, 0.8)
  Top 0.2: J2.36 140.4,23.6 139.7,22.9
  Top 0.61: PIN3.2 122.72,117.9 120.2,117.9 119,116.7 119,104.7 126.9,96.8 v126.9,50.3 | v126.9,30.7 126.9,28.6 132.6,22.9 139.7,22.9
  Bottom 0.61: v126.9,50.3 v126.9,30.7
GATE_PWR  (1 unrouted)
GND  (via drill 0.7, 0.8, 0.9, 1.3)  (6 unrouted)
  Top 0.2: J1.31 139.6,72.9
  Top 0.61: v121.9,6.62 125.73,6.62 IC1.2 | v110.4,20.5 112.9,20.5 | 112.9,20.5 116.53,20.5 J3.9 113.77,20.54 | J3.3 116.53,24.38 112.78,24.38 | 112.78,24.38 112.7,24.3 112.7,23.2 112.8,23.1 116.54,23.1 J3.5 113.88,23.07 112.8,22 112.8,20.6 112.9,20.5 | 112.78,24.38 111.98,24.38 | 111.98,24.38 v110.5,22.9 | v139.5,3.6 R2.1 140.55,5.35 v141.7,4.2 | 111.98,24.38 110.12,24.38 v108.7,24.8 | IC3.1 6.7,109.2 | v3.6,109.2 IC3.1 | C2.1 6.88,109.2 IC3.1 | P2.10 140.3,107.6 143.3,107.6 | 143.3,107.6 145.3,107.6 P2.5 145.3,101.9 v147,100.2 | P2.7 143.3,107.6 | v141.2,87.9 139.6,86.3 139.6,72.9
  Top 0.813: 34.3,3.7 ZENIT_POWER_-.MP 31.5,6.4 13.9,6.4 2.4,17.9 GND.MP | 34.3,4.1 34.3,3.7 | 34.3,3.7 37,1 48.4,1 BATT_-.MP 53.5,1.3 61.9,1.3 64.5,3.9 ROTOR_POWER_-.MP | TL_2576-5V.3 6.42,61 9.82,61 TL_2576-5V.5
  Top 1.27: TL_2576-5V.3 6.42,55.69 D5.2
  Top 1.676: v10.8,53.7 8.81,53.7 D5.2 | GND.MP 2.7,27.7 12.7,27.7 15.1,30.1 15.1,33.58 C3.-
  Route2 0.61: v110.5,22.9 120.2,22.9 v139.5,3.6 | 146.89,91.1 148.3,91.1 155,84.4 155,3.5 153.1,1.6 143.5,1.6 141.7,3.4 | 146.89,91.1 141.2,91.1 | 141.2,91.1 127,91.1 120.7,97.4 120.7,109.2 121.8,110.3 122.74,110.3 PIN3.5 | v147,100.2 147,91.21 146.89,91.1 | ROTOR_POWER_-.MP 68,0.7 116.5,0.7 121.9,6.1 v121.9,6.62 | v141.2,87.9 141.2,91.1
  Route2 0.813: v110.4,20.5 121.9,9 v121.9,6.62
  Bottom 0.406: 1.6,95.4 1.6,95.5
  Bottom 0.813: v3.59,109.2 v3.6,109.2 1.6,107.2 1.6,95.5 1.6,81.85 C1.-
  Bottom 1.27: C1.- 6.45,77 12.9,77 16.6,73.3 16.6,58.2 12.1,53.7 v10.8,53.7
  Bottom 1.676: v10.8,53.7 10.8,37.92 C3.-
I2C0-SCL  (via drill 0.6, 0.8, 0.9)
  Top 0.2: J1.46 142.4,65.5 v143.4,64.5
  Top 0.61: R4.2 21.3,96.6 19.8,98.1 11.06,98.1 IC3.4
  Top 0.813: IC3.4 6.18,101.58 5.7,101.1 5.7,91.8 7.2,90.3 9.6,90.3 16.5,83.4 16.5,75.2 19.9,71.8 19.9,48.9 v22.1,46.7
  Route15 0.61: v97.9,16.2 143.4,61.7 v143.4,64.5
  Bottom 0.813: v22.1,46.7 22.1,40.7 20.6,39.2 20.6,9.3 23.3,6.6 31,6.6 32,7.6 89.3,7.6 v97.9,16.2
I2C0-SDA  (via drill 0.6, 0.8, 0.9)
  Top 0.2: J1.44 142,67.8 v140.1,65.9
  Top 0.61: R3.2 v14.3,91.4
  Top 0.813: IC3.3 5.22,104.12 4.5,103.4 4.5,89.9 5.9,88.5 8.8,88.5 14.8,82.5 14.8,74.5 18.4,71.1 18.5,48.1 v19,47.2
  Route15 0.813: v110.4,14.5 142.3,14.5 v146.1,18.3
  Bottom 0.61: v140.1,65.9 140.1,24.3 v146.1,18.3
  Bottom 0.813: 110.3,14.6 v110.4,14.5 110.4,9.7 101.5,0.8 24.1,0.8 19,5.9 v19,47.2 19,86.7 v14.3,91.4
N$1  (via drill 0.6)
  other vias: 2.8,63.6
N$2  (1 unrouted)
N$3  (via drill 0.6)
  other vias: 6.2,63.6
N$4  (via drill 0.6)
  other vias: 9.9,63.6
N$5  (via drill 0.6)
  other vias: 2.7,67.2
N$6  (via drill 0.6)
  other vias: 6.2,67.2
N$7  (via drill 0.6)
  other vias: 9.8,67.2
N$8  (via drill 0.6)
  other vias: 9.9,70.7
N$9  (via drill 0.6)
  other vias: 6.2,70.7
N$10  (via drill 0.6)
  other vias: 2.7,70.7
N$11  (2 unrouted)
N$12  (2 unrouted)
N$13  (1 unrouted)
N$14  (1 unrouted)
N$15
  Top 0.61: IC1.8 132.71,7.91 133.3,8.5 138.25,8.5 R2.2
PWM5  (via drill 0.6)
  Top 0.2: 145.2,23 J2.60
  Top 0.61: v149,21.9 149,21.1 148.1,20.2 146.8,20.2 145.2,21.8 145.2,23 | P2.4 146.3,103.1 v147.4,102
  Bottom 0.61: v149,21.9 149,66.2 151.4,68.6 151.4,98 v147.4,102
PWM9_SYNC  (via drill 0.6)  (2 unrouted)
  Top 0.2: v146.8,22.8 J2.68
  Top 0.61: P2.6 144.3,101.2 v145,100.5
  Bottom 0.61: v145,100.5 145,77.7 141.9,74.6 141.9,24.5 144.5,21.9 145.9,21.9 v146.8,22.8
RESET  (via drill 0.6, 0.7)
  Top 0.2: v148,75 J1.73
  Top 0.61: v128.97,20.52 120.65,20.52 J3.10
  Route15 0.61: v128.97,20.52 131.52,20.52 149,38 149,66.6 151.7,69.3 151.7,72.4 149.1,75 v148,75
SAO  (via drill 0.6)
  Top 0.2: J2.40 141.2,19.4 140,18.2
  Top 0.61: v134.6,88.1 134.6,115.9 129.98,120.52 PIN3.1 | v138.1,17.8 139.6,17.8 140,18.2
  Bottom 0.61: v134.6,88.1 134.6,86.9 133.5,85.8 133.5,18.7 134.4,17.8 v138.1,17.8
SCL  (via drill 0.6)
  Top 0.2: J2.38 140.8,19.8 140,19 136.7,19 136.6,19
  Top 0.61: v132.5,88.1 132.5,110.3 129.9,112.9 PIN3.4 | v135.3,19 136.7,19
  Route2 0.61: v131.1,22.3 v135.3,19
  Bottom 0.61: v132.5,88.1 131.1,86.7 v131.1,22.3
SDA  (via drill 0.6, 0.7)
  Top 0.2: J2.42 141.6,18.9
  Top 0.254: 122.84,115.4 PIN3.3
  Top 0.61: v131.1,115.4 122.84,115.4 | v143.4,18.9 141.6,18.9
  Bottom 0.61: v131.1,115.4 131.4,115.4 137.5,109.3 137.5,87.6 134.9,85 134.9,22.3 136.6,20.6 141.7,20.6 v143.4,18.9
TCK/SWCLK  (via drill 0.6, 0.7)
  Top 0.2: J1.77 148.8,70.2 149.3,69.7 150.3,69.7 150.9,69.1 v150.9,66.9
  Top 0.305: v125.08,24.36 125.14,24.36 125.2,24.3
  Top 0.61: v125.08,24.36 120.65,24.36 J3.4
  Route2 0.61: v122.7,44.2 136.6,58.1 136.6,65.8 137.7,66.9 v150.9,66.9
  Bottom 0.305: 125.2,24.24 v125.08,24.36
  Bottom 0.61: v122.7,44.2 122.7,26.74 v125.08,24.36
TDO/SWO  (via drill 0.6, 0.7)
  Top 0.2: 149.2,73.4 J1.79
  Top 0.254: 120.71,23 J3.6
  Top 0.61: v123.7,23 120.71,23 | v152.5,74.5 150.3,74.5 149.2,73.4
  Bottom 0.61: v123.7,23 123.7,18.9 127.1,15.5 146.4,15.5 150.7,19.8 150.7,49 155,53.3 155,72 v152.5,74.5
TMS/SWDIO  (via drill 0.6, 0.7)
  Top 0.2: 150.2,68.8 149.7,69.3 149.2,69.3 148.4,70.1 J1.75
  Top 0.61: v126.3,25.6 120.65,25.6 J3.2 | v147.7,64.8 149.8,66.9 149.8,68.1 150.2,68.5 150.2,68.8
  Route15 0.61: v126.3,25.6 134.6,25.6 147.7,38.7 v147.7,64.8
VBAT  (5 unrouted)
VBAT_RAW  (8 unrouted)

### Text on the board
tNames: K1_ROT_V0.1_rev3.9 | SAO | SOX | CS | SCX | SDA | P2 | INT1 | SCL | INT2 | GND | OCS | 3V3 | VIN | P1 | C1 | 330UF | TL_12-V. | VIN-5V | D5 | L | C3 | 100UF | MOTOR +50V | MOTOR - | RESET | ROT_POWER + | ROT_POWER - | BAT + | BAT -